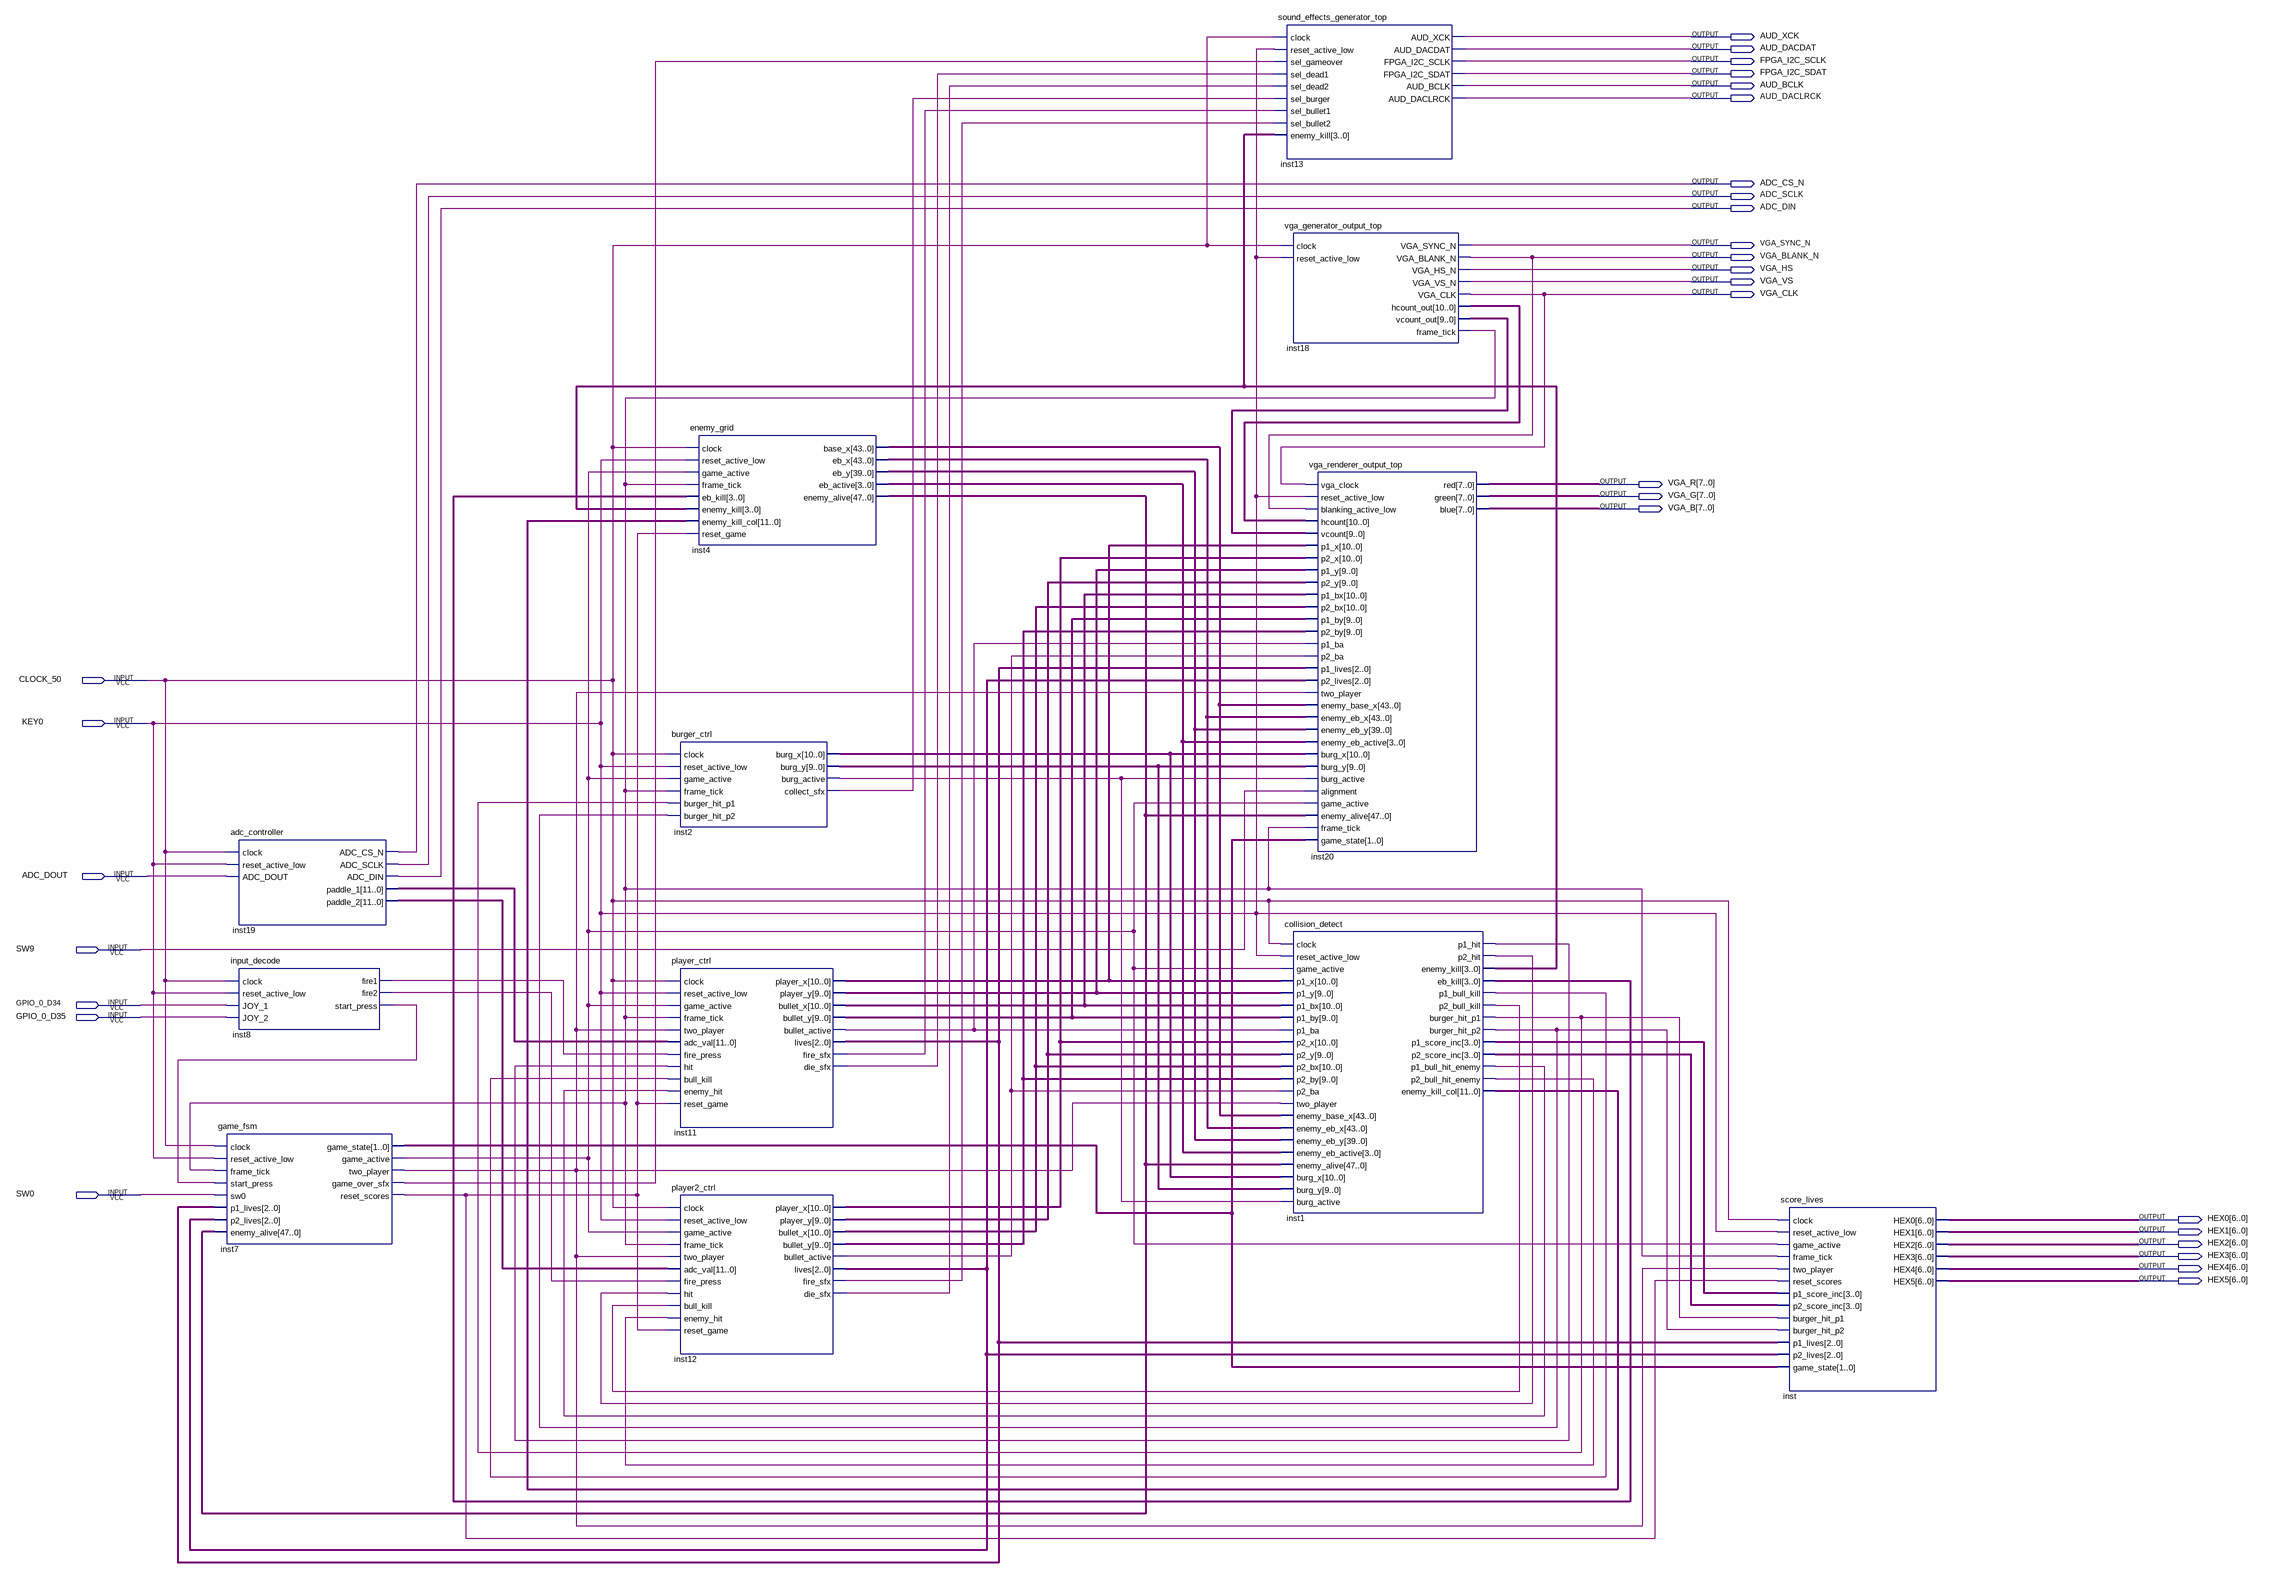
[diagram p0: schematic sheet]
// Quartus schematic final_project_top.bdf as structural Verilog: 12 symbols, 30 pins
module final_project_top (
  input  CLOCK_50,
  input  KEY0,
  input  ADC_DOUT,
  input  SW9,
  input  GPIO_0_D34,
  input  GPIO_0_D35,
  input  SW0,
  output AUD_XCK,
  output AUD_DACDAT,
  output FPGA_I2C_SCLK,
  output FPGA_I2C_SDAT,
  output AUD_BCLK,
  output AUD_DACLRCK,
  output ADC_CS_N,
  output ADC_SCLK,
  output ADC_DIN,
  output VGA_SYNC_N,
  output VGA_BLANK_N,
  output VGA_HS,
  output VGA_VS,
  output VGA_CLK,
  output [7:0] VGA_R,
  output [7:0] VGA_G,
  output [7:0] VGA_B,
  output [6:0] HEX0,
  output [6:0] HEX1,
  output [6:0] HEX2,
  output [6:0] HEX3,
  output [6:0] HEX4,
  output [6:0] HEX5
);

  wire inst1_burger_hit_p1, inst1_burger_hit_p2, inst1_p1_bull_hit_enemy, inst1_p1_bull_kill, inst1_p1_hit,
       inst1_p2_bull_hit_enemy, inst1_p2_bull_kill, inst1_p2_hit, inst2_burg_active, inst2_collect_sfx,
       inst7_game_active, inst7_game_over_sfx, inst7_reset_scores, inst7_two_player, inst8_fire1,
       inst8_fire2, inst8_start_press, inst11_bullet_active, inst11_die_sfx, inst11_fire_sfx,
       inst12_bullet_active, inst12_die_sfx, inst12_fire_sfx, inst18_frame_tick;
  wire [1:0] inst7_game_state;
  wire [2:0] inst11_lives, inst12_lives;
  wire [3:0] inst1_eb_kill, inst1_enemy_kill, inst1_p1_score_inc, inst1_p2_score_inc, inst4_eb_active;
  wire [9:0] inst2_burg_y, inst11_bullet_y, inst11_player_y, inst12_bullet_y, inst12_player_y,
       inst18_vcount_out;
  wire [10:0] inst2_burg_x, inst11_bullet_x, inst11_player_x, inst12_bullet_x, inst12_player_x,
       inst18_hcount_out;
  wire [11:0] inst1_enemy_kill_col, inst19_paddle_1, inst19_paddle_2;
  wire [39:0] inst4_eb_y;
  wire [43:0] inst4_base_x, inst4_eb_x;
  wire [47:0] inst4_enemy_alive;

  adc_controller inst19 (
    .clock(CLOCK_50), .reset_active_low(KEY0), .ADC_DOUT(ADC_DOUT), .ADC_CS_N(ADC_CS_N), .ADC_SCLK(ADC_SCLK),
    .ADC_DIN(ADC_DIN), .paddle_1(inst19_paddle_1), .paddle_2(inst19_paddle_2));
  input_decode inst8 (
    .clock(CLOCK_50), .reset_active_low(KEY0), .JOY_1(GPIO_0_D34), .JOY_2(GPIO_0_D35), .fire1(inst8_fire1),
    .fire2(inst8_fire2), .start_press(inst8_start_press));
  game_fsm inst7 (
    .clock(CLOCK_50), .reset_active_low(KEY0), .frame_tick(inst18_frame_tick),
    .start_press(inst8_start_press), .sw0(SW0), .p1_lives(inst11_lives), .p2_lives(inst12_lives),
    .enemy_alive(inst4_enemy_alive), .game_state(inst7_game_state), .game_active(inst7_game_active),
    .two_player(inst7_two_player), .game_over_sfx(inst7_game_over_sfx), .reset_scores(inst7_reset_scores));
  enemy_grid inst4 (
    .clock(CLOCK_50), .reset_active_low(KEY0), .game_active(inst7_game_active),
    .frame_tick(inst18_frame_tick), .eb_kill(inst1_eb_kill), .enemy_kill(inst1_enemy_kill),
    .enemy_kill_col(inst1_enemy_kill_col), .reset_game(inst7_reset_scores), .base_x(inst4_base_x),
    .eb_x(inst4_eb_x), .eb_y(inst4_eb_y), .eb_active(inst4_eb_active), .enemy_alive(inst4_enemy_alive));
  burger_ctrl inst2 (
    .clock(CLOCK_50), .reset_active_low(KEY0), .game_active(inst7_game_active),
    .frame_tick(inst18_frame_tick), .burger_hit_p1(inst1_burger_hit_p1), .burger_hit_p2(inst1_burger_hit_p2),
    .burg_x(inst2_burg_x), .burg_y(inst2_burg_y), .burg_active(inst2_burg_active),
    .collect_sfx(inst2_collect_sfx));
  player_ctrl inst11 (
    .clock(CLOCK_50), .reset_active_low(KEY0), .game_active(inst7_game_active),
    .frame_tick(inst18_frame_tick), .two_player(inst7_two_player), .adc_val(inst19_paddle_1),
    .fire_press(inst8_fire1), .hit(inst1_p1_hit), .bull_kill(inst1_p1_bull_kill),
    .enemy_hit(inst1_p1_bull_hit_enemy), .reset_game(inst7_reset_scores), .player_x(inst11_player_x),
    .player_y(inst11_player_y), .bullet_x(inst11_bullet_x), .bullet_y(inst11_bullet_y),
    .bullet_active(inst11_bullet_active), .lives(inst11_lives), .fire_sfx(inst11_fire_sfx),
    .die_sfx(inst11_die_sfx));
  player2_ctrl inst12 (
    .clock(CLOCK_50), .reset_active_low(KEY0), .game_active(inst7_game_active),
    .frame_tick(inst18_frame_tick), .two_player(inst7_two_player), .adc_val(inst19_paddle_2),
    .fire_press(inst8_fire2), .hit(inst1_p2_hit), .bull_kill(inst1_p2_bull_kill),
    .enemy_hit(inst1_p2_bull_hit_enemy), .reset_game(inst7_reset_scores), .player_x(inst12_player_x),
    .player_y(inst12_player_y), .bullet_x(inst12_bullet_x), .bullet_y(inst12_bullet_y),
    .bullet_active(inst12_bullet_active), .lives(inst12_lives), .fire_sfx(inst12_fire_sfx),
    .die_sfx(inst12_die_sfx));
  sound_effects_generator_top inst13 (
    .clock(CLOCK_50), .reset_active_low(KEY0), .sel_gameover(inst7_game_over_sfx),
    .sel_dead1(inst11_die_sfx), .sel_dead2(inst12_die_sfx), .sel_burger(inst2_collect_sfx),
    .sel_bullet1(inst11_fire_sfx), .sel_bullet2(inst12_fire_sfx), .enemy_kill(inst1_enemy_kill),
    .AUD_XCK(AUD_XCK), .AUD_DACDAT(AUD_DACDAT), .FPGA_I2C_SCLK(FPGA_I2C_SCLK), .FPGA_I2C_SDAT(FPGA_I2C_SDAT),
    .AUD_BCLK(AUD_BCLK), .AUD_DACLRCK(AUD_DACLRCK));
  vga_generator_output_top inst18 (
    .clock(CLOCK_50), .reset_active_low(KEY0), .VGA_SYNC_N(VGA_SYNC_N), .VGA_BLANK_N(VGA_BLANK_N),
    .VGA_HS_N(VGA_HS), .VGA_VS_N(VGA_VS), .VGA_CLK(VGA_CLK), .hcount_out(inst18_hcount_out),
    .vcount_out(inst18_vcount_out), .frame_tick(inst18_frame_tick));
  collision_detect inst1 (
    .clock(CLOCK_50), .reset_active_low(KEY0), .game_active(inst7_game_active), .p1_x(inst11_player_x),
    .p1_y(inst11_player_y), .p1_bx(inst11_bullet_x), .p1_by(inst11_bullet_y), .p1_ba(inst11_bullet_active),
    .p2_x(inst12_player_x), .p2_y(inst12_player_y), .p2_bx(inst12_bullet_x), .p2_by(inst12_bullet_y),
    .p2_ba(inst12_bullet_active), .two_player(inst7_two_player), .enemy_base_x(inst4_base_x),
    .enemy_eb_x(inst4_eb_x), .enemy_eb_y(inst4_eb_y), .enemy_eb_active(inst4_eb_active),
    .enemy_alive(inst4_enemy_alive), .burg_x(inst2_burg_x), .burg_y(inst2_burg_y),
    .burg_active(inst2_burg_active), .p1_hit(inst1_p1_hit), .p2_hit(inst1_p2_hit),
    .enemy_kill(inst1_enemy_kill), .eb_kill(inst1_eb_kill), .p1_bull_kill(inst1_p1_bull_kill),
    .p2_bull_kill(inst1_p2_bull_kill), .burger_hit_p1(inst1_burger_hit_p1),
    .burger_hit_p2(inst1_burger_hit_p2), .p1_score_inc(inst1_p1_score_inc),
    .p2_score_inc(inst1_p2_score_inc), .p1_bull_hit_enemy(inst1_p1_bull_hit_enemy),
    .p2_bull_hit_enemy(inst1_p2_bull_hit_enemy), .enemy_kill_col(inst1_enemy_kill_col));
  vga_renderer_output_top inst20 (
    .vga_clock(VGA_CLK), .reset_active_low(KEY0), .blanking_active_low(VGA_BLANK_N),
    .hcount(inst18_hcount_out), .vcount(inst18_vcount_out), .p1_x(inst11_player_x), .p2_x(inst12_player_x),
    .p1_y(inst11_player_y), .p2_y(inst12_player_y), .p1_bx(inst11_bullet_x), .p2_bx(inst12_bullet_x),
    .p1_by(inst11_bullet_y), .p2_by(inst12_bullet_y), .p1_ba(inst11_bullet_active),
    .p2_ba(inst12_bullet_active), .p1_lives(inst11_lives), .p2_lives(inst12_lives),
    .two_player(inst7_two_player), .enemy_base_x(inst4_base_x), .enemy_eb_x(inst4_eb_x),
    .enemy_eb_y(inst4_eb_y), .enemy_eb_active(inst4_eb_active), .burg_x(inst2_burg_x), .burg_y(inst2_burg_y),
    .burg_active(inst2_burg_active), .alignment(SW9), .game_active(inst7_game_active),
    .enemy_alive(inst4_enemy_alive), .frame_tick(inst18_frame_tick), .game_state(inst7_game_state),
    .red(VGA_R), .green(VGA_G), .blue(VGA_B));
  score_lives inst (
    .clock(CLOCK_50), .reset_active_low(KEY0), .game_active(inst7_game_active),
    .frame_tick(inst18_frame_tick), .two_player(inst7_two_player), .reset_scores(inst7_reset_scores),
    .p1_score_inc(inst1_p1_score_inc), .p2_score_inc(inst1_p2_score_inc),
    .burger_hit_p1(inst1_burger_hit_p1), .burger_hit_p2(inst1_burger_hit_p2), .p1_lives(inst11_lives),
    .p2_lives(inst12_lives), .game_state(inst7_game_state), .HEX0(HEX0), .HEX1(HEX1), .HEX2(HEX2),
    .HEX3(HEX3), .HEX4(HEX4), .HEX5(HEX5));
endmodule
